# EasyEDA Pro project ProPrj_zuizhong2.epro, schematic zuizhong
Board Name: zuizhong; Create Date: 2025-02-10; Page Name: Sheet_1; Project Name: zuizhong; Schematic Name: zuizhong; Update Date: 2025-02-10; Add into BOM: yes; Company: Your Company; Convert to PCB: yes; Date: 2025-02-10; Draw By: ljy_yz; REV: 1.0; Sheet: 1/1
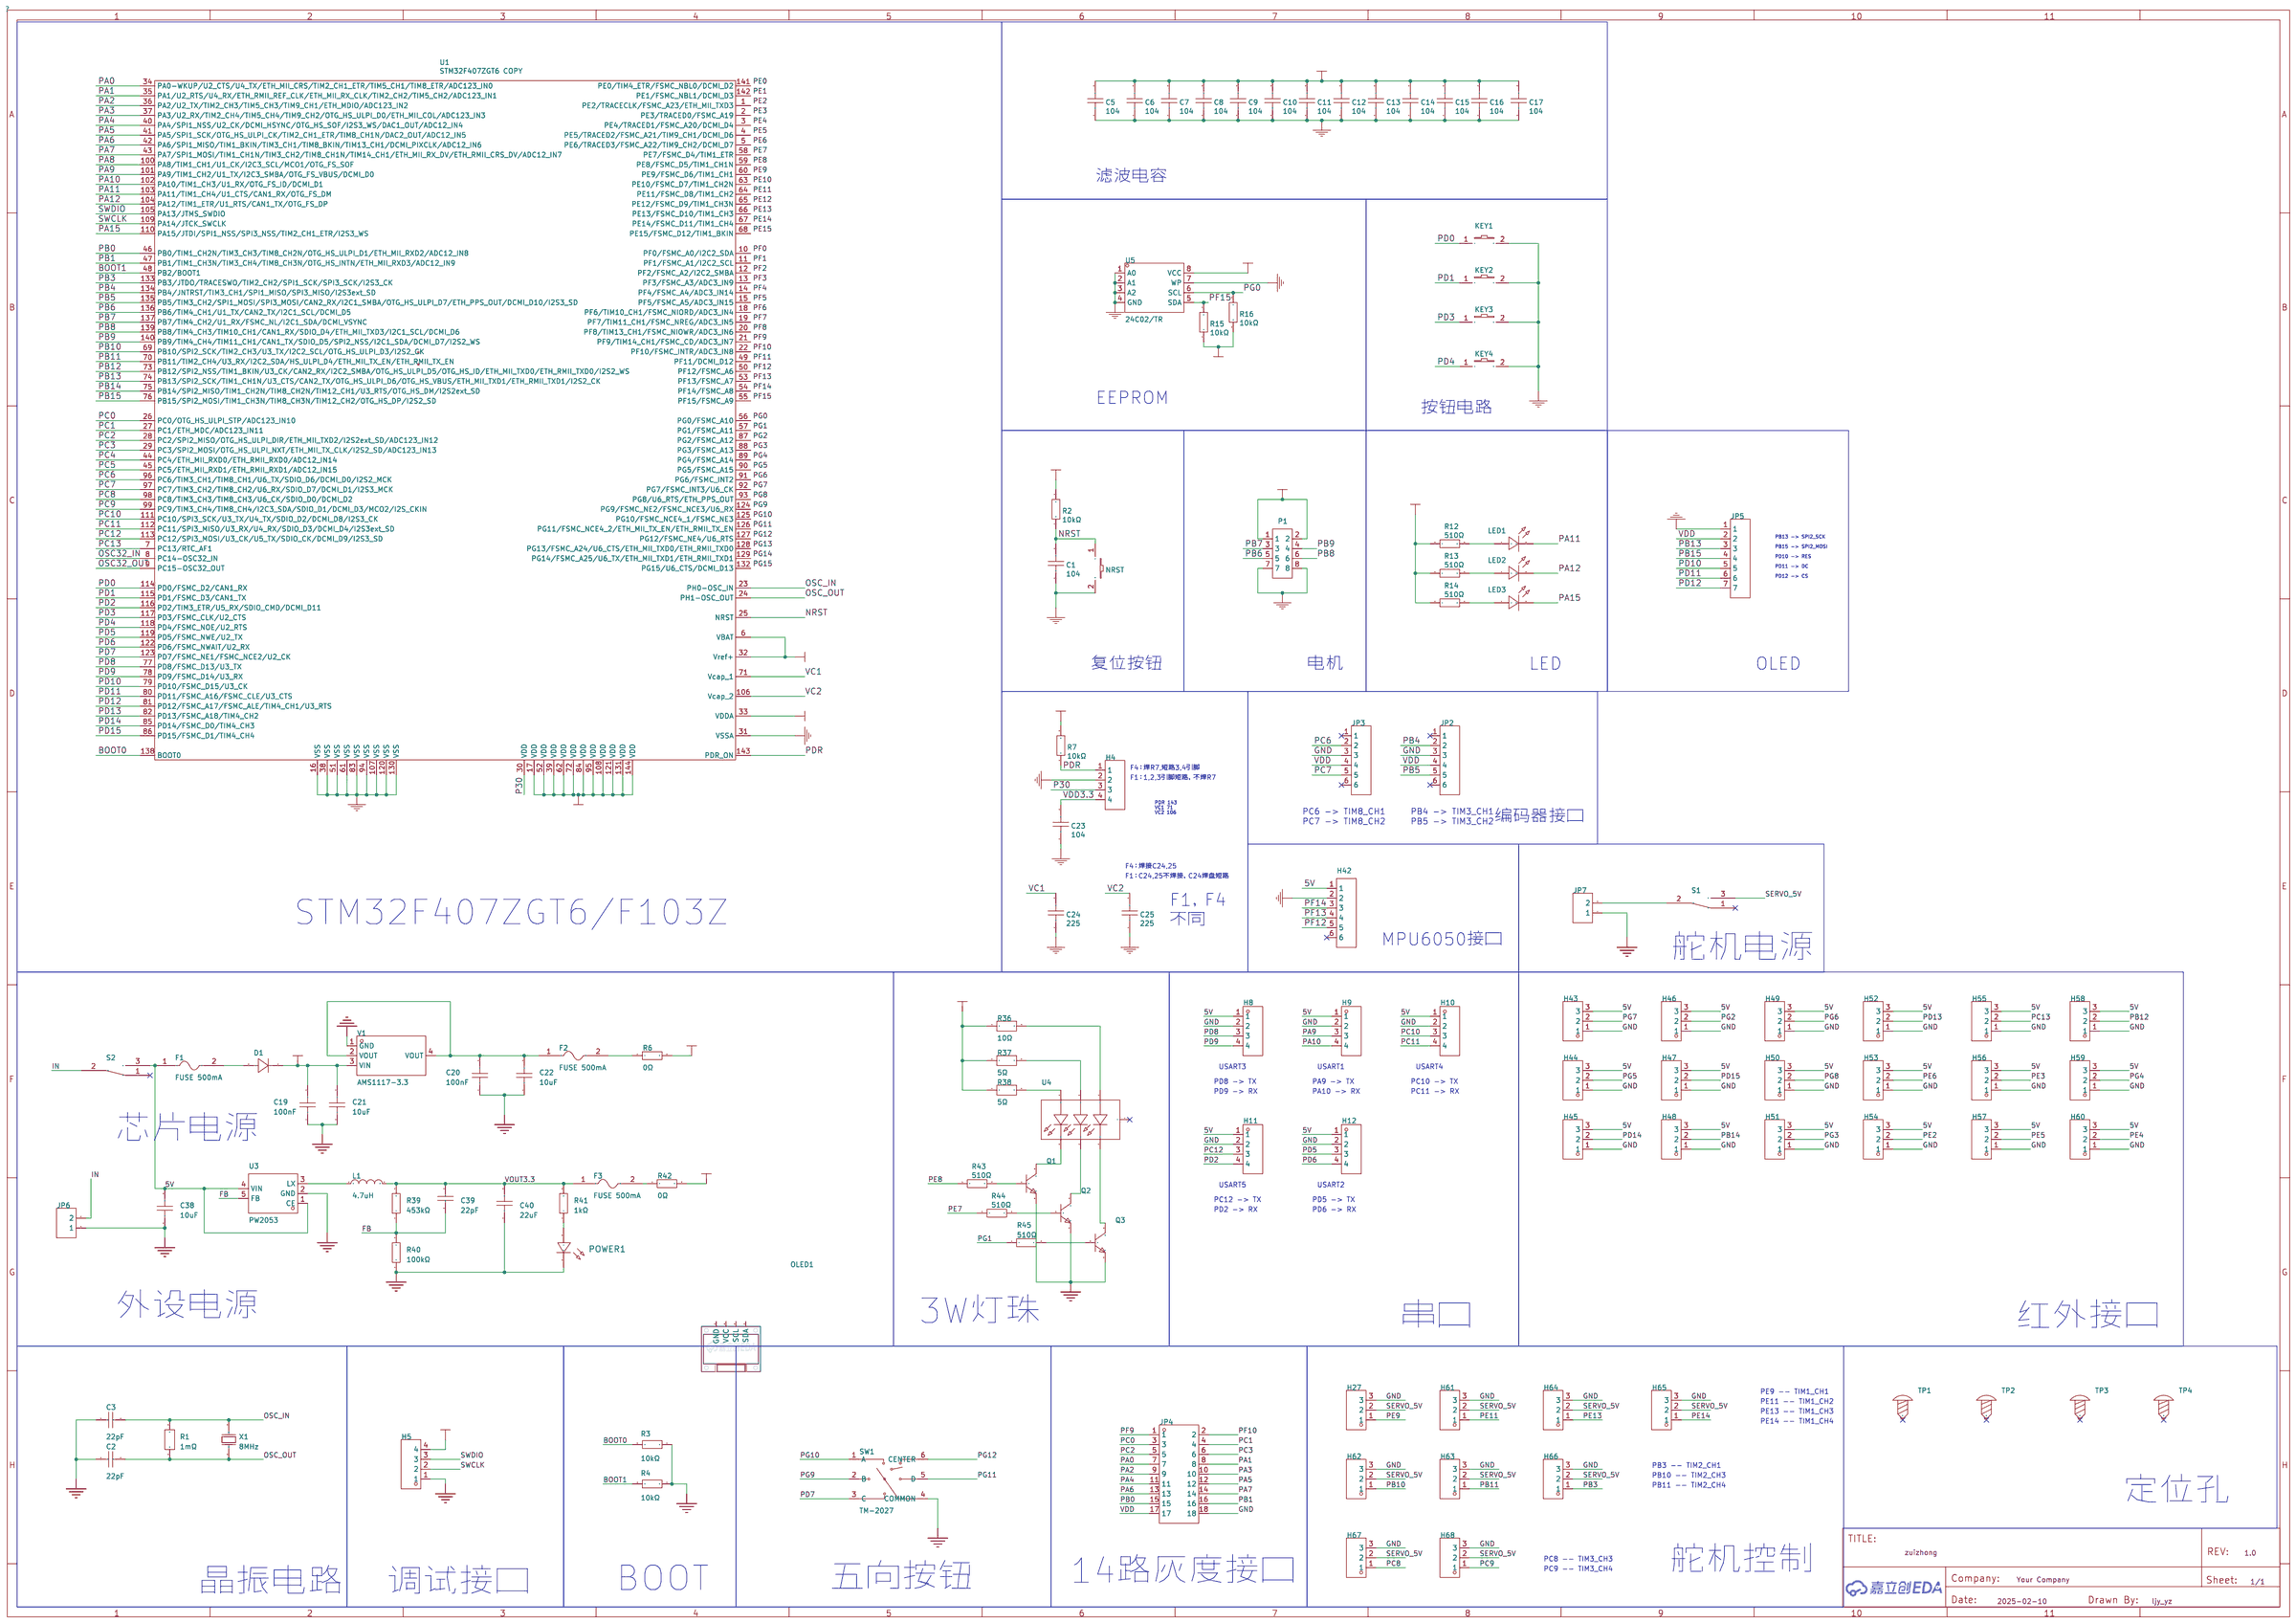
[diagram p0: schematic sheet]

## Parts
C1  104  [C0603]
C2  22pF  [C0603]
C3  22pF  [C0603]
C5  104  [C0603]
C6  104  [C0603]
C7  104  [C0603]
C8  104  [C0603]
C9  104  [C0603]
C10  104  [C0603]
C11  104  [C0603]
C12  104  [C0603]
C13  104  [C0603]
C14  104  [C0603]
C15  104  [C0603]
C16  104  [C0603]
C17  104  [C0603]
C19  100nF  [C0603]
C20  100nF  [C0603]
C21  10uF  [C0603]
C22  10uF  [C0603]
C23  104  [C0603]
C24  225  [C0603]
C25  225  [C0603]
C38  10uF  [C0603]
C39  22pF  [C0603]
C40  22uF  [C0805]
D1  -  [DO_1N4007]
F1  FUSE 500mA  [F1812]
F2  FUSE 500mA  [F1812]
F3  FUSE 500mA  [F1812]
H4  PZ254V-11-04P  [HDR-TH_4P-P2.54-V-M-1]
H5  PZ254V-11-04P  [HDR-TH_4P-P2.54-V-M]
H8  PZ254V-11-04P  [HDR-TH_4P-P2.54-V-M]
H9  PZ254V-11-04P  [HDR-TH_4P-P2.54-V-M]
H10  PZ254V-11-04P  [HDR-TH_4P-P2.54-V-M]
H11  PZ254V-11-04P  [HDR-TH_4P-P2.54-V-M]
H12  PZ254V-11-04P  [HDR-TH_4P-P2.54-V-M]
H27  PZ254V-11-03P  [HDR-TH_3P-P2.54-V-M]
H42  PZ254V-11-06P  [HDR-TH_6P-P2.54-V-M-1]
H43  PZ254V-11-03P  [HDR-TH_3P-P2.54-V-M]
H44  PZ254V-11-03P  [HDR-TH_3P-P2.54-V-M]
H45  PZ254V-11-03P  [HDR-TH_3P-P2.54-V-M]
H46  PZ254V-11-03P  [HDR-TH_3P-P2.54-V-M]
H47  PZ254V-11-03P  [HDR-TH_3P-P2.54-V-M]
H48  PZ254V-11-03P  [HDR-TH_3P-P2.54-V-M]
H49  PZ254V-11-03P  [HDR-TH_3P-P2.54-V-M]
H50  PZ254V-11-03P  [HDR-TH_3P-P2.54-V-M]
H51  PZ254V-11-03P  [HDR-TH_3P-P2.54-V-M]
H52  PZ254V-11-03P  [HDR-TH_3P-P2.54-V-M]
H53  PZ254V-11-03P  [HDR-TH_3P-P2.54-V-M]
H54  PZ254V-11-03P  [HDR-TH_3P-P2.54-V-M]
H55  PZ254V-11-03P  [HDR-TH_3P-P2.54-V-M]
H56  PZ254V-11-03P  [HDR-TH_3P-P2.54-V-M]
H57  PZ254V-11-03P  [HDR-TH_3P-P2.54-V-M]
H58  PZ254V-11-03P  [HDR-TH_3P-P2.54-V-M]
H59  PZ254V-11-03P  [HDR-TH_3P-P2.54-V-M]
H60  PZ254V-11-03P  [HDR-TH_3P-P2.54-V-M]
H61  PZ254V-11-03P  [HDR-TH_3P-P2.54-V-M]
H62  PZ254V-11-03P  [HDR-TH_3P-P2.54-V-M]
H63  PZ254V-11-03P  [HDR-TH_3P-P2.54-V-M]
H64  PZ254V-11-03P  [HDR-TH_3P-P2.54-V-M]
H65  PZ254V-11-03P  [HDR-TH_3P-P2.54-V-M]
H66  PZ254V-11-03P  [HDR-TH_3P-P2.54-V-M]
H67  PZ254V-11-03P  [HDR-TH_3P-P2.54-V-M]
H68  PZ254V-11-03P  [HDR-TH_3P-P2.54-V-M]
JP2  PZ254V-11-06P  [HDR-TH_6P-P2.54-V-M-1]
JP3  PZ254V-11-06P  [HDR-TH_6P-P2.54-V-M-1]
JP4  PZ254V-12-18P  [HDR-TH_18P-P2.54-V-M-R2-C9-S2.54]
JP5  PM254V-11-07-H85  [HDR-TH_7P-P2.54-V-M-1]
JP6  -  [HDR-TH_2P-P2.54-V-F]
JP7  -  [HDR-TH_2P-P2.54-V-F]
KEY1  K2-3.6×6.1_SMD  [Key_SMD_3x4x2]
KEY2  K2-3.6×6.1_SMD  [Key_SMD_3x4x2]
KEY3  K2-3.6×6.1_SMD  [Key_SMD_3x4x2]
KEY4  K2-3.6×6.1_SMD  [Key_SMD_3x4x2]
L1  4.7uH  [IND-SMD_L2.5-W2.0-VLS252012CX-150M]
LED1  LED-0603_R  [LED0603-RD_WHITE]
LED2  LED-0603_R  [LED0603-RD_WHITE]
LED3  LED-0603_R  [LED0603-RD_WHITE]
NRST  K2-3.6×6.1_SMD  [Key_SMD_3x4x2]
OLED1  -  [0.96OLED_4P]
P1  PM254-2-04-W-8.5  [HDR-TH_8P-P2.54-H-F-R2-C4-W8.5]
POWER1  -  [LED_0603]
Q1  -  [S8050_SOT-23]
Q2  -  [S8050_SOT-23]
Q3  -  [S8050_SOT-23]
R1  1mΩ  [RES-SMD_L6.4-W3.2-R2512]
R2  10kΩ  [R0603_NEW]
R3  10kΩ  [R0603_NEW]
R4  10kΩ  [R0603_NEW]
R6  0Ω  [R0603]
R7  10kΩ  [R0603_NEW]
R12  510Ω  [R0603_NEW]
R13  510Ω  [R0603_NEW]
R14  510Ω  [R0603_NEW]
R15  10kΩ  [R0603_NEW]
R16  10kΩ  [R0603_NEW]
R36  10Ω  [R2512]
R37  5Ω  [R2512]
R38  5Ω  [R2512]
R39  453kΩ  [R0402]
R40  100kΩ  [R0603]
R41  1kΩ  [R0603]
R42  0Ω  [R0603]
R43  510Ω  [R0603_NEW]
R44  510Ω  [R0603_NEW]
R45  510Ω  [R0603_NEW]
S1  MT-0-102-A101-M200-RS  [SW-TH_MT-0-103-A101-M200-RS]
S2  MT-0-102-A101-M200-RS  [SW-TH_MT-0-103-A101-M200-RS]
SW1  TM-2027  [SW-SMD_6P-P2.80-L10.2-W10.2]
TP1  -  [M3螺丝]
TP2  -  [M3螺丝]
TP3  -  [M3螺丝]
TP4  -  [M3螺丝]
U1  STM32F407ZGT6 COPY  [LQFP-144_L20.0-W20.0-P0.50-LS22.0-BL]
U3  PW2053  [SOT-23-5_L2.9-W1.6-P0.95-LS2.8-BL]
U4  XL-HD6070RGBC-A46L-BD  [LED-SMD_6P-BD8.0-LS14.5]
U5  24C02/TR  [SOIC-8_L5.0-W4.0-P1.27-LS6.0-BL]
V1  AMS1117-3.3  [SOT-223-3_L6.5-W3.4-P2.30-LS7.0-BR]
X1  8MHz  [OSC-SMD_L5.0-W3.2]

## Library data of the parts
C1 C5-C17 C23 = 104: Supplier: LCSC; Supplier Part: C6119867; Manufacturer: HRE(芯声); Manufacturer Part: CGA0603X7R104K500JT; JLCPCB Part Class: Extended Part
C2 C3 C39 = CC0603JRNPO9BN220: 容值:22pF;精度:±5%;额定电压:50V;材质(温度系数):NP0;; LCSC Part Name: 22pF ±5% 50V; Supplier Part: C105620; Manufacturer: YAGEO(国巨); Supplier Footprint: 0603; JLCPCB Part Class: 扩展库; Datasheet: https://atta.szlcsc.com/upload/public/pdf/source/20170505/1493957838062.pdf; Supplier: LCSC; Tolerance: ±5%; Voltage Rated: 50V; Temperature Coefficient: NP0
C19 C20 = CGA0603X7R104K500JT: 容值:100nF;精度:±10%;额定电压:50V;材质(温度系数):X7R;; LCSC Part Name: 100nF ±10% 50V; Supplier Part: C6119867; Manufacturer: HRE(芯声); Supplier Footprint: 0603; JLCPCB Part Class: 扩展库; Supplier: LCSC; Tolerance: ±10%; Voltage Rated: 50V; Temperature Coefficient: X7R
C21 C22 C38 = CGA0603X5R106K100JT: 容值:10uF;精度:±10%;额定电压:10V;材质(温度系数):X5R;; LCSC Part Name: 10uF ±10% 10V; Supplier Part: C6119842; Manufacturer: HRE(芯声); Supplier Footprint: 0603; JLCPCB Part Class: 扩展库; Supplier: LCSC; Tolerance: ±10%; Voltage Rated: 10V; Temperature Coefficient: X5R
C24 C25 = 225: Supplier: LCSC; Supplier Part: C913904; Manufacturer: SAMSUNG(三星); Manufacturer Part: CL10A225KB8NNNC; JLCPCB Part Class: Extended Part
C40 = CGA0805X5R226M350MT: 容值:22uF;精度:±20%;额定电压:35V;材质(温度系数):X5R;; LCSC Part Name: 22uF ±20% 35V; Supplier Part: C6119901; Manufacturer: HRE(芯声); Supplier Footprint: 0805; JLCPCB Part Class: 扩展库; Datasheet: https://atta.szlcsc.com/upload/public/pdf/source/20231129/D589D0CC4D260F7AC3A77E53B455CCB3.pdf; Supplier: LCSC; Tolerance: ±20%; Voltage Rated: 35V; Temperature Coefficient: X5R
D1 = D_1N4007A: Supplier Footprint: DO-41
F1-F3 = mSMD050-60V: 最大电压:60V;最大电流:100A;保持电流:500mA;跳闸电流:1A;; LCSC Part Name: 0.50A  60V 自恢复保险丝; Supplier Part: C70113; Manufacturer: 台湾陆海; Supplier Footprint: 1812; JLCPCB Part Class: 扩展库; Datasheet: https://atta.szlcsc.com/upload/public/pdf/source/20210511/C70113_9F360CEF46030BB0E1728371F919C576.pdf; Supplier: LCSC; Operating Voltage (Max): 60V; Current Rating (Max): 100A; Hold Current: 500mA; Trip Current: 1A
H4 = PZ254V-11-04P: Supplier: LCSC; Supplier Part: C2691448; Manufacturer: XFCN(兴飞); JLCPCB Part Class: Extended Part
H5 H8-H12 = PZ254V-11-04P: 插针结构:1x4P;间距:2.54mm;行距:-;圆针/方针:方针;安装类型:直插;排数:单排;总PIN位数:4P;额定电流:3A;额定电压:250V;配合针长度:6mm;塑高:2.5mm;端接针长度:3mm;触头材质:-;工作温度范围:-40℃~+105℃;颜色:黑色;; LCSC Part Name: 间距:2.54mm 1x4P 直插 方针; Supplier Part: C2691448; Manufacturer: XFCN(兴飞); Supplier Footprint: 插件,P=2.54mm; JLCPCB Part Class: 扩展库; Datasheet: https://atta.szlcsc.com/upload/public/pdf/source/20200309/C492403_F9F19131791D08044AD4F84F8E751A34.pdf; Supplier: LCSC; Pin Structure: 1x4P; Pitch: 2.54mm; Circluar Pins/Square Pins: 方针; Mounting Type: 直插; Number of Rows: 单排; Number of Pins: 4P; Current Rating (Max): 3A; Voltage Rating (Max): 250V; Length of Mating Pin: 6mm; Insulation Height: 2.5mm; Length of End Connection Pin: 3mm; Operating Temperature Range: -40℃~+105℃; Color: 黑色
H27 H43-H68 = PZ254V-11-03P: 插针结构:1x3P;间距:2.54mm;行距:-;圆针/方针:方针;安装类型:直插;排数:单排;总PIN位数:3P;额定电流:3A;额定电压:250V;配合针长度:6mm;塑高:2.5mm;端接针长度:3mm;工作温度范围:-40℃~+105℃;颜色:黑色;; LCSC Part Name: 间距:2.54mm 1x3P 直插 方针; Supplier Part: C2937625; Manufacturer: XFCN(兴飞); Supplier Footprint: 插件,P=2.54mm; JLCPCB Part Class: 扩展库; Datasheet: https://atta.szlcsc.com/upload/public/pdf/source/20200309/C492402_8335C3D49C4E4C618838D59BB1D024C1.pdf; Supplier: LCSC; Pin Structure: 1x3P; Pitch: 2.54mm; Circluar Pins/Square Pins: 方针; Mounting Type: 直插; Number of Rows: 单排; Number of Pins: 3P; Current Rating (Max): 3A; Voltage Rating (Max): 250V; Length of Mating Pin: 6mm; Insulation Height: 2.5mm; Length of End Connection Pin: 3mm; Operating Temperature Range: -40℃~+105℃; Color: 黑色
H42 JP2 JP3 = PZ254V-11-06P: Supplier: LCSC; Supplier Part: C492405; Manufacturer: XFCN(兴飞); JLCPCB Part Class: Extended Part
JP4 = PZ254V-12-18P: 插针结构:2x9P;间距:2.54mm;行距:2.54mm;圆针/方针:方针;安装类型:直插;排数:双排;总PIN位数:18P;额定电流:-;额定电压:-;配合针长度:6mm;塑高:2.5mm;端接针长度:3mm;触头材质:黄铜;触头镀层:-;工作温度范围:-40℃~+105℃;颜色:黑色;; LCSC Part Name: 间距:2.54mm 2x9P 直插 方针; Supplier Part: C492426; Manufacturer: XFCN(兴飞); Supplier Footprint: 插件,P=2.54mm; JLCPCB Part Class: 扩展库; Datasheet: https://atta.szlcsc.com/upload/public/pdf/source/20200309/C492426_5A028E8D656C282E0A73DD02D6DCA7C4.pdf; Supplier: LCSC; Pin Structure: 2x9P; Pitch: 2.54mm; Row Spacing: 2.54mm; Circluar Pins/Square Pins: 方针; Mounting Type: 直插; Number of Rows: 双排; Number of Pins: 18P; Length of Mating Pin: 6mm; Insulation Height: 2.5mm; Length of End Connection Pin: 3mm; Contact Material: 黄铜; Operating Temperature Range: -40℃~+105℃; Color: 黑色
JP5 = PM254V-11-07-H85: Supplier: LCSC; Supplier Part: C2832270; Manufacturer: XFCN(兴飞); JLCPCB Part Class: Extended Part
JP6 JP7 = HDR-F_2.54_1x2P: Supplier Part: C49661; Supplier Footprint: 插件
KEY1-KEY4 NRST = K2-3.6×6.1_SMD: Supplier Part: C118141; Supplier: LCSC; Manufacturer Part: K2-1107ST-A4SW-06; 制造商: 韩国韩荣
L1 = FTC252010S4R7MBCA: 电感值:4.7uH;精度:±20%;额定电流:2A;饱和电流(Isat):2.6A;类型:一体成型电感;; LCSC Part Name: 4.7uH ±20% 2.6A; Supplier Part: C5832360; Manufacturer: cjiang(长江微电); Supplier Footprint: SMD,2x2.5mm; JLCPCB Part Class: 扩展库; Datasheet: https://atta.szlcsc.com/upload/public/pdf/source/20230602/8FFEDA9C0247A92A0D4B67554BFE4091.pdf; Supplier: LCSC; Tolerance: ±20%; Rated Current: 2A; Saturation Current (Isat): 2.6A; DC Resistance (DCR): 160mΩ; Type: 一体成型电感
LED1-LED3 = LED-0603_R: Manufacturer: EVERLIGHT(台湾亿光); Manufacturer Part: 19-217/R6C-AL1M2VY/3T; Supplier Part: C72044; Supplier: LCSC
OLED1 = 0.96OLED模块_4P: Supplier Footprint: 插件
P1 = PM254-2-04-W-8.5: Supplier: LCSC; Supplier Part: C2897424; Manufacturer: HCTL(华灿天禄); JLCPCB Part Class: Extended Part
POWER1 = LED_0603-R: Supplier Footprint: 0603
Q1-Q3 = S8050_SOT_NPN: Supplier Footprint: SOT-23
R1 = HoJLR2512-3W-1mR-1%: 电阻类型:采样电阻;阻值:1mΩ;精度:±1%;功率:3W;安装方式:贴片;; LCSC Part Name: 1mΩ ±1% 3W; Supplier Part: C2903470; Manufacturer: Milliohm(毫欧); Supplier Footprint: 2512; JLCPCB Part Class: 扩展库; Datasheet: https://atta.szlcsc.com/upload/public/pdf/source/20211009/7525CABAB363C979E942C1DD41F1FEF0.pdf; Supplier: LCSC; Type: 采样电阻; Tolerance: ±1%; Power(Watts): 3W; Mounting Sytle: 贴片
R2-R4 R7 R15 R16 = 10kΩ: Supplier: LCSC; Manufacturer: UNI-ROYAL(厚声); Manufacturer Part: 0603WAF1002T5E; Supplier Part: C25804; JLCPCB Part Class: Basic Part
R6 R42 = 0603WAF0000T5E: 电阻类型:厚膜电阻;阻值:0Ω;精度:±1%;功率:100mW;最大工作电压:75V;; LCSC Part Name: 0Ω ±1% 100mW 厚膜电阻; Supplier Part: C21189; Manufacturer: UNI-ROYAL(厚声); Supplier Footprint: 0603; JLCPCB Part Class: 基础库; Datasheet: https://atta.szlcsc.com/upload/public/pdf/source/20200306/C422600_1E6D84923E4A46A82E41ADD87F860B5C.pdf; Supplier: LCSC; Type: 厚膜电阻; Tolerance: ±1%; Power(Watts): 100mW; Overload Voltage (Max): 75V; Operating Temperature Range: -55℃~+155℃
R12-R14 R43-R45 = 510Ω: Supplier: LCSC; Manufacturer: UNI-ROYAL(厚声); Manufacturer Part: 0603WAF5100T5E; Supplier Part: C23193; JLCPCB Part Class: Basic Part
R36 = FRP2512J100 TS: 电阻类型:厚膜电阻;阻值:10Ω;精度:±5%;功率:2W;最大工作电压:200V;温度系数:±200ppm/℃;; LCSC Part Name: 10Ω ±5% 2W 厚膜电阻; Supplier Part: C3013385; Manufacturer: FOJAN(富捷); Supplier Footprint: 2512; JLCPCB Part Class: 扩展库; Datasheet: https://atta.szlcsc.com/upload/public/pdf/source/20211221/925EC7D7225764EE0046F22065062C87.pdf; Supplier: LCSC; Type: 厚膜电阻; Tolerance: ±5%; Power(Watts): 2W; Overload Voltage (Max): 200V; Temperature Coefficient: ±200ppm/℃
R37 R38 = HoAR2512-1W-5R-0.1%-TCR25: 电阻类型:陶瓷电阻;阻值:5Ω;精度:±0.1%;功率:1W;温度系数:±25ppm/℃;; LCSC Part Name: 陶瓷电阻 5Ω ±0.1% 1W; Supplier Part: C5123609; Manufacturer: Milliohm(毫欧); Supplier Footprint: 2512; JLCPCB Part Class: 扩展库; Datasheet: https://atta.szlcsc.com/upload/public/pdf/source/20220805/BC8894D01B21B12D20FF0E940066DD50.pdf; Supplier: LCSC; Type: 陶瓷电阻; Tolerance: ±0.1%; Power(Watts): 1W; Temperature Coefficient: ±25ppm/℃
R39 = 0402WGF4533TCE: 电阻类型:厚膜电阻;阻值:453kΩ;精度:±1%;功率:62.5mW;最大工作电压:50V;温度系数:±100ppm/℃;; LCSC Part Name: 453kΩ ±1% 62.5mW 厚膜电阻; Supplier Part: C27009; Manufacturer: UNI-ROYAL(厚声); Supplier Footprint: 0402; JLCPCB Part Class: 扩展库; Datasheet: https://atta.szlcsc.com/upload/public/pdf/source/20200306/C422600_1E6D84923E4A46A82E41ADD87F860B5C.pdf; Supplier: LCSC; Type: 厚膜电阻; Tolerance: ±1%; Power(Watts): 62.5mW; Overload Voltage (Max): 50V; Temperature Coefficient: ±100ppm/℃; Operating Temperature Range: -55℃~+155℃
R40 = 0603WAF1003T5E: 电阻类型:厚膜电阻;阻值:100kΩ;精度:±1%;功率:100mW;最大工作电压:75V;温度系数:±100ppm/℃;; LCSC Part Name: 100kΩ ±1% 100mW 厚膜电阻; Supplier Part: C25803; Manufacturer: UNI-ROYAL(厚声); Supplier Footprint: 0603; JLCPCB Part Class: 基础库; Datasheet: https://atta.szlcsc.com/upload/public/pdf/source/20200306/C422600_1E6D84923E4A46A82E41ADD87F860B5C.pdf; Supplier: LCSC; Type: 厚膜电阻; Tolerance: ±1%; Power(Watts): 100mW; Overload Voltage (Max): 75V; Temperature Coefficient: ±100ppm/℃; Operating Temperature Range: -55℃~+155℃
R41 = 0603WAF1001T5E: 电阻类型:厚膜电阻;阻值:1kΩ;精度:±1%;功率:100mW;最大工作电压:75V;温度系数:±100ppm/℃;; LCSC Part Name: 1kΩ ±1% 100mW 厚膜电阻; Supplier Part: C21190; Manufacturer: UNI-ROYAL(厚声); Supplier Footprint: 0603; JLCPCB Part Class: 基础库; Datasheet: https://atta.szlcsc.com/upload/public/pdf/source/20200306/C422600_1E6D84923E4A46A82E41ADD87F860B5C.pdf; Supplier: LCSC; Type: 厚膜电阻; Tolerance: ±1%; Power(Watts): 100mW; Overload Voltage (Max): 75V; Temperature Coefficient: ±100ppm/℃; Operating Temperature Range: -55℃~+155℃
S1 S2 = MT-0-102-A101-M200-RS: 电路结构:单刀双掷;机械寿命:-;额定电流:5A;额定电压(AC):125V;安装方式:直插;; LCSC Part Name: 小型钮子三脚二档 五件套; Supplier Part: C1788492; Manufacturer: YUEN FUNG(源丰); Supplier Footprint: 插件; JLCPCB Part Class: 扩展库; Datasheet: https://atta.szlcsc.com/upload/public/pdf/source/20230720/8E5C36EFDF374AE4FF4AC09DB233CE0E.pdf; Supplier: LCSC; Circuit: 单刀双掷; Switch Length: 13mm; Switch Width: 8mm; Switch Height: 28.6mm; Contact Current: 5A; Voltage Rating (AC): 125V; Actuator Type: 圆柱钮柄; Pin Style: 焊片; Mounting Style: 直插; Operating Temperature: -25℃~+85℃
SW1 = TM-2027: LCSC Part Name: 10*10多功能五向开关; Supplier Part: C318948; Manufacturer: XKB Connection(中国星坤); Supplier Footprint: SMD-6P,10x10mm; JLCPCB Part Class: 扩展库; Datasheet: https://atta.szlcsc.com/upload/public/pdf/source/20211015/9A47D7046B5F70B5D407F93F21F2FBAF.pdf; Supplier: LCSC
TP1-TP4 = M3螺丝: Supplier Footprint: 插件
U1 = STM32F407ZGT6 COPY: Supplier: 鸿星尔克
U3 = PW2053: Supplier Part: C9900013179; Supplier Footprint: SOT-23-5; JLCPCB Part Class: 扩展库; Supplier: LCSC
U4 = XL-HD6070RGBC-A46L-BD: 6070球头七彩3W（6脚） 仿流明/大功率 回流焊≤220℃; LCSC Part Name: 球头七彩; Supplier Part: C22434861; Manufacturer: XINGLIGHT(成兴光); Supplier Footprint: SMD8080-6P; JLCPCB Part Class: 扩展库; Datasheet: https://atta.szlcsc.com/upload/public/pdf/source/20240516/D3778ABDB5CABE9CC0417A8C2EA1DFA9.pdf; Supplier: LCSC
U5 = 24C02/TR: 接口类型:I2C;存储容量:2Kbit;时钟频率(fc):1MHz;; LCSC Part Name: 24C02/TR 停产; Supplier Part: C316692; Manufacturer: HGSEMI(华冠); Supplier Footprint: SOIC-8; JLCPCB Part Class: 扩展库; Datasheet: https://atta.szlcsc.com/upload/public/pdf/source/20181022/C316692_1A8AF8718EBD0B12F50671BDFB0B8E66.pdf; Supplier: LCSC; Interface Type: I2C; Memory Size: 2Kbit; Clock Frequency (fc): 1MHz; Supply Voltage: 1.7V~5.5V; Write Cycle Time (Tw): 5ms; Data Retention - TDR (Year): 100年; Write Cycle Endurance: 1000000次; Operating Temperature: -40℃~+85℃
V1 = AMS1117-3.3_C6186: 输出类型:固定;最大输入电压:-;输出电压:3.3V;最大输出电流:1A;电源纹波抑制比(PSRR):72dB@(120Hz);输出极性:正极;; LCSC Part Name: 输出3.3V 1A; Supplier Part: C6186; Manufacturer: AMS; Supplier Footprint: SOT-223; JLCPCB Part Class: 基础库; Datasheet: https://atta.szlcsc.com/upload/public/pdf/source/20180727/C6186_7A095716F0823C02F1997A905E26C086.pdf; Supplier: LCSC; Output Type: 固定; Output Voltage: 3.3V; MAX Output Current: 1A; Power Supply Rejection Ratio (PSRR): 72dB@(120Hz); Dropout Voltage: 1.3V@(800mA); Output Polarity: 正极; Number of Outputs: 1
X1 = TAXM8M2QLFCDT1T: 晶振类型:贴片晶振;频率:8MHz;常温频差:±30ppm;外接负载电容:20pF;频率稳定度(全温):±20ppm;; LCSC Part Name: 8MHz ±30ppm 20pF; Supplier Part: C122522; Manufacturer: YJX(雅晶鑫); Supplier Footprint: SMD5032; JLCPCB Part Class: 扩展库; Datasheet: https://atta.szlcsc.com/upload/public/pdf/source/20220113/59EE8A0E7B9F67FF1BF3C454890DE4E5.pdf; Supplier: LCSC; Crystal Type: 贴片晶振; Normal temperature Frequency Tolerance: ±30ppm; External load capacitor: 20pF; Frequency Stability(Full temperature range): ±20ppm; Equivalent Series Resistance (ESR): 80Ω; Operating Temperature: -40℃~+85℃

## Nets
5V: C38.2 F1.1 H8.1 H9.1 H10.1 H11.1 H12.1 H42.1 H43.3 H44.3 H45.3 H46.3 H47.3 H48.3 H49.3 H50.3 H51.3 H52.3 H53.3 H54.3 H55.3 H56.3 H57.3 H58.3 H59.3 H60.3 R36.1 R37.1 R38.1 S2.3 U3.1(CE) U3.4(VIN)
GND: C1.1 C2.1 C3.1 C5.1 C6.1 C7.1 C8.1 C9.1 C10.1 C11.1 C12.1 C13.1 C14.1 C15.1 C16.1 C17.1 C19.1 C20.1 C21.1 C22.1 C23.1 C24.1 C25.1 C38.1 C40.1 H4.2 H5.1 H8.2 H9.2 H10.2 H11.2 H12.2 H27.3 H42.2 H43.1 H44.1 H45.1 H46.1 H47.1 H48.1 H49.1 H50.1 H51.1 H52.1 H53.1 H54.1 H55.1 H56.1 H57.1 H58.1 H59.1 H60.1 H61.3 H62.3 H63.3 H64.3 H65.3 H66.3 H67.3 H68.3 JP2.3 JP3.3 JP4.18 JP5.1 JP6.1 JP7.1 KEY1.2 KEY2.2 KEY3.2 KEY4.2 NRST.2 P1.7 P1.8 POWER1.1(C) Q1.2 Q2.2 Q3.2 R3.1 R4.1 R40.1 SW1.4(COMMON) U1.16(VSS) U1.31(VSSA) U1.38(VSS) U1.51(VSS) U1.61(VSS) U1.83(VSS) U1.94(VSS) U1.107(VSS) U1.120(VSS) U1.130(VSS) U3.2(GND) U5.1(A0) U5.2(A1) U5.3(A2) U5.4(GND) U5.7(WP) V1.1(GND)
VDD: JP2.4 JP3.4 JP4.17 JP5.2 P1.1 P1.2 R42.2
VDD3.3: C5.2 C6.2 C7.2 C8.2 C9.2 C10.2 C11.2 C12.2 C13.2 C14.2 C15.2 C16.2 C17.2 C23.2 H4.4 H5.4 R2.2 R6.2 R7.2 R12.1 R13.1 R14.1 R15.1 R16.1 U1.6(VBAT) U1.17(VDD) U1.32(Vref+) U1.33(VDDA) U1.39(VDD) U1.52(VDD) U1.62(VDD) U1.72(VDD) U1.84(VDD) U1.95(VDD) U1.108(VDD) U1.121(VDD) U1.131(VDD) U1.144(VDD) U5.8(VCC)
BOOT0: R3.2 U1.138(BOOT0)
BOOT1: R4.2 U1.48(PB2/BOOT1)
FB: C39.1 R39.1 R40.2 U3.5(FB)
IN: JP6.2 S2.2
NRST: C1.2 NRST.1 R2.1 U1.25(NRST)
OSC32_IN: U1.8(PC14-OSC32_IN)
OSC32_OUT: U1.9(PC15-OSC32_OUT)
OSC_IN: C3.2 R1.2 U1.23(PH0-OSC_IN) X1.2(OSC2)
OSC_OUT: C2.2 R1.1 U1.24(PH1-OSC_OUT) X1.1(OSC1)
P30: H4.3 U1.30(VDD)
PA0: JP4.7 U1.34(PA0-WKUP/U2_CTS/U4_TX/ETH_MII_CRS/TIM2_CH1_ETR/TIM5_CH1/TIM8_ETR/ADC123_IN0)
PA1: JP4.8 U1.35(PA1/U2_RTS/U4_RX/ETH_RMII_REF_CLK/ETH_MII_RX_CLK/TIM2_CH2/TIM5_CH2/ADC123_IN1)
PA2: JP4.9 U1.36(PA2/U2_TX/TIM2_CH3/TIM5_CH3/TIM9_CH1/ETH_MDIO/ADC123_IN2)
PA3: JP4.10 U1.37(PA3/U2_RX/TIM2_CH4/TIM5_CH4/TIM9_CH2/OTG_HS_ULPI_D0/ETH_MII_COL/ADC123_IN3)
PA4: JP4.11 U1.40(PA4/SPI1_NSS/U2_CK/DCMI_HSYNC/OTG_HS_SOF/I2S3_WS/DAC1_OUT/ADC12_IN4)
PA5: JP4.12 U1.41(PA5/SPI1_SCK/OTG_HS_ULPI_CK/TIM2_CH1_ETR/TIM8_CH1N/DAC2_OUT/ADC12_IN5)
PA6: JP4.13 U1.42(PA6/SPI1_MISO/TIM1_BKIN/TIM3_CH1/TIM8_BKIN/TIM13_CH1/DCMI_PIXCLK/ADC12_IN6)
PA7: JP4.14 U1.43(PA7/SPI1_MOSI/TIM1_CH1N/TIM3_CH2/TIM8_CH1N/TIM14_CH1/ETH_MII_RX_DV/ETH_RMII_CRS_DV/ADC12_IN7)
PA8: U1.100(PA8/TIM1_CH1/U1_CK/I2C3_SCL/MCO1/OTG_FS_SOF)
PA9: H9.3 U1.101(PA9/TIM1_CH2/U1_TX/I2C3_SMBA/OTG_FS_VBUS/DCMI_D0)
PA10: H9.4 U1.102(PA10/TIM1_CH3/U1_RX/OTG_FS_ID/DCMI_D1)
PA11: LED1.2 U1.103(PA11/TIM1_CH4/U1_CTS/CAN1_RX/OTG_FS_DM)
PA12: LED2.2 U1.104(PA12/TIM1_ETR/U1_RTS/CAN1_TX/OTG_FS_DP)
PA15: LED3.2 U1.110(PA15/JTDI/SPI1_NSS/SPI3_NSS/TIM2_CH1_ETR/I2S3_WS)
PB0: JP4.15 U1.46(PB0/TIM1_CH2N/TIM3_CH3/TIM8_CH2N/OTG_HS_ULPI_D1/ETH_MII_RXD2/ADC12_IN8)
PB1: JP4.16 U1.47(PB1/TIM1_CH3N/TIM3_CH4/TIM8_CH3N/OTG_HS_INTN/ETH_MII_RXD3/ADC12_IN9)
PB3: H66.1 U1.133(PB3/JTDO/TRACESWO/TIM2_CH2/SPI1_SCK/SPI3_SCK/I2S3_CK)
PB4: JP2.2 U1.134(PB4/JNTRST/TIM3_CH1/SPI1_MISO/SPI3_MISO/I2S3ext_SD)
PB5: JP2.5 U1.135(PB5/TIM3_CH2/SPI1_MOSI/SPI3_MOSI/CAN2_RX/I2C1_SMBA/OTG_HS_ULPI_D7/ETH_PPS_OUT/DCMI_D10/I2S3_SD)
PB6: P1.5 U1.136(PB6/TIM4_CH1/U1_TX/CAN2_TX/I2C1_SCL/DCMI_D5)
PB7: P1.3 U1.137(PB7/TIM4_CH2/U1_RX/FSMC_NL/I2C1_SDA/DCMI_VSYNC)
PB8: P1.6 U1.139(PB8/TIM4_CH3/TIM10_CH1/CAN1_RX/SDIO_D4/ETH_MII_TXD3/I2C1_SCL/DCMI_D6)
PB9: P1.4 U1.140(PB9/TIM4_CH4/TIM11_CH1/CAN1_TX/SDIO_D5/SPI2_NSS/I2C1_SDA/DCMI_D7/I2S2_WS)
PB10: H62.1 U1.69(PB10/SPI2_SCK/TIM2_CH3/U3_TX/I2C2_SCL/OTG_HS_ULPI_D3/I2S2_CK)
PB11: H63.1 U1.70(PB11/TIM2_CH4/U3_RX/I2C2_SDA/HS_ULPI_D4/ETH_MII_TX_EN/ETH_RMII_TX_EN)
PB12: H58.2 U1.73(PB12/SPI2_NSS/TIM1_BKIN/U3_CK/CAN2_RX/I2C2_SMBA/OTG_HS_ULPI_D5/OTG_HS_ID/ETH_MII_TXD0/ETH_RMII_TXD0/I2S2_WS)
PB13: JP5.3 U1.74(PB13/SPI2_SCK/TIM1_CH1N/U3_CTS/CAN2_TX/OTG_HS_ULPI_D6/OTG_HS_VBUS/ETH_MII_TXD1/ETH_RMII_TXD1/I2S2_CK)
PB14: H48.2 U1.75(PB14/SPI2_MISO/TIM1_CH2N/TIM8_CH2N/TIM12_CH1/U3_RTS/OTG_HS_DM/I2S2ext_SD)
PB15: JP5.4 U1.76(PB15/SPI2_MOSI/TIM1_CH3N/TIM8_CH3N/TIM12_CH2/OTG_HS_DP/I2S2_SD)
PC0: JP4.3 U1.26(PC0/OTG_HS_ULPI_STP/ADC123_IN10)
PC1: JP4.4 U1.27(PC1/ETH_MDC/ADC123_IN11)
PC2: JP4.5 U1.28(PC2/SPI2_MISO/OTG_HS_ULPI_DIR/ETH_MII_TXD2/I2S2ext_SD/ADC123_IN12)
PC3: JP4.6 U1.29(PC3/SPI2_MOSI/OTG_HS_ULPI_NXT/ETH_MII_TX_CLK/I2S2_SD/ADC123_IN13)
PC4: U1.44(PC4/ETH_MII_RXD0/ETH_RMII_RXD0/ADC12_IN14)
PC5: U1.45(PC5/ETH_MII_RXD1/ETH_RMII_RXD1/ADC12_IN15)
PC6: JP3.2 U1.96(PC6/TIM3_CH1/TIM8_CH1/U6_TX/SDIO_D6/DCMI_D0/I2S2_MCK)
PC7: JP3.5 U1.97(PC7/TIM3_CH2/TIM8_CH2/U6_RX/SDIO_D7/DCMI_D1/I2S3_MCK)
PC8: H67.1 U1.98(PC8/TIM3_CH3/TIM8_CH3/U6_CK/SDIO_D0/DCMI_D2)
PC9: H68.1 U1.99(PC9/TIM3_CH4/TIM8_CH4/I2C3_SDA/SDIO_D1/DCMI_D3/MCO2/I2S_CKIN)
PC10: H10.3 U1.111(PC10/SPI3_SCK/U3_TX/U4_TX/SDIO_D2/DCMI_D8/I2S3_CK)
PC11: H10.4 U1.112(PC11/SPI3_MISO/U3_RX/U4_RX/SDIO_D3/DCMI_D4/I2S3ext_SD)
PC12: H11.3 U1.113(PC12/SPI3_MOSI/U3_CK/U5_TX/SDIO_CK/DCMI_D9/I2S3_SD)
PC13: H55.2 U1.7(PC13/RTC_AF1)
PD0: KEY1.1 U1.114(PD0/FSMC_D2/CAN1_RX)
PD1: KEY2.1 U1.115(PD1/FSMC_D3/CAN1_TX)
PD2: H11.4 U1.116(PD2/TIM3_ETR/U5_RX/SDIO_CMD/DCMI_D11)
PD3: KEY3.1 U1.117(PD3/FSMC_CLK/U2_CTS)
PD4: KEY4.1 U1.118(PD4/FSMC_NOE/U2_RTS)
PD5: H12.3 U1.119(PD5/FSMC_NWE/U2_TX)
PD6: H12.4 U1.122(PD6/FSMC_NWAIT/U2_RX)
PD7: SW1.3(C) U1.123(PD7/FSMC_NE1/FSMC_NCE2/U2_CK)
PD8: H8.3 U1.77(PD8/FSMC_D13/U3_TX)
PD9: H8.4 U1.78(PD9/FSMC_D14/U3_RX)
PD10: JP5.5 U1.79(PD10/FSMC_D15/U3_CK)
PD11: JP5.6 U1.80(PD11/FSMC_A16/FSMC_CLE/U3_CTS)
PD12: JP5.7 U1.81(PD12/FSMC_A17/FSMC_ALE/TIM4_CH1/U3_RTS)
PD13: H52.2 U1.82(PD13/FSMC_A18/TIM4_CH2)
PD14: H45.2 U1.85(PD14/FSMC_D0/TIM4_CH3)
PD15: H47.2 U1.86(PD15/FSMC_D1/TIM4_CH4)
PDR: H4.1 R7.1 U1.143(PDR_ON)
PE0: U1.141(PE0/TIM4_ETR/FSMC_NBL0/DCMI_D2)
PE1: U1.142(PE1/FSMC_NBL1/DCMI_D3)
PE2: H54.2 U1.1(PE2/TRACECLK/FSMC_A23/ETH_MII_TXD3)
PE3: H56.2 U1.2(PE3/TRACED0/FSMC_A19)
PE4: H60.2 U1.3(PE4/TRACED1/FSMC_A20/DCMI_D4)
PE5: H57.2 U1.4(PE5/TRACED2/FSMC_A21/TIM9_CH1/DCMI_D6)
PE6: H53.2 U1.5(PE6/TRACED3/FSMC_A22/TIM9_CH2/DCMI_D7)
PE7: R44.1 U1.58(PE7/FSMC_D4/TIM1_ETR)
PE8: R43.1 U1.59(PE8/FSMC_D5/TIM1_CH1N)
PE9: H27.1 U1.60(PE9/FSMC_D6/TIM1_CH1)
PE10: U1.63(PE10/FSMC_D7/TIM1_CH2N)
PE11: H61.1 U1.64(PE11/FSMC_D8/TIM1_CH2)
PE12: U1.65(PE12/FSMC_D9/TIM1_CH3N)
PE13: H64.1 U1.66(PE13/FSMC_D10/TIM1_CH3)
PE14: H65.1 U1.67(PE14/FSMC_D11/TIM1_CH4)
PE15: U1.68(PE15/FSMC_D12/TIM1_BKIN)
PF0: U1.10(PF0/FSMC_A0/I2C2_SDA)
PF1: U1.11(PF1/FSMC_A1/I2C2_SCL)
PF2: U1.12(PF2/FSMC_A2/I2C2_SMBA)
PF3: U1.13(PF3/FSMC_A3/ADC3_IN9)
PF4: U1.14(PF4/FSMC_A4/ADC3_IN14)
PF5: U1.15(PF5/FSMC_A5/ADC3_IN15)
PF6: U1.18(PF6/TIM10_CH1/FSMC_NIORD/ADC3_IN4)
PF7: U1.19(PF7/TIM11_CH1/FSMC_NREG/ADC3_IN5)
PF8: U1.20(PF8/TIM13_CH1/FSMC_NIOWR/ADC3_IN6)
PF9: JP4.1 U1.21(PF9/TIM14_CH1/FSMC_CD/ADC3_IN7)
PF10: JP4.2 U1.22(PF10/FSMC_INTR/ADC3_IN8)
PF11: U1.49(PF11/DCMI_D12)
PF12: H42.5 U1.50(PF12/FSMC_A6)
PF13: H42.4 U1.53(PF13/FSMC_A7)
PF14: H42.3 U1.54(PF14/FSMC_A8)
PF15: R15.2 U1.55(PF15/FSMC_A9) U5.5(SDA)
PG0: R16.2 U1.56(PG0/FSMC_A10) U5.6(SCL)
PG1: R45.1 U1.57(PG1/FSMC_A11)
PG2: H46.2 U1.87(PG2/FSMC_A12)
PG3: H51.2 U1.88(PG3/FSMC_A13)
PG4: H59.2 U1.89(PG4/FSMC_A14)
PG5: H44.2 U1.90(PG5/FSMC_A15)
PG6: H49.2 U1.91(PG6/FSMC_INT2)
PG7: H43.2 U1.92(PG7/FSMC_INT3/U6_CK)
PG8: H50.2 U1.93(PG8/U6_RTS/ETH_PPS_OUT)
PG9: SW1.2(B) U1.124(PG9/FSMC_NE2/FSMC_NCE3/U6_RX)
PG10: SW1.1(A) U1.125(PG10/FSMC_NCE4_1/FSMC_NE3)
PG11: SW1.5(D) U1.126(PG11/FSMC_NCE4_2/ETH_MII_TX_EN/ETH_RMII_TX_EN)
PG12: SW1.6(CENTER) U1.127(PG12/FSMC_NE4/U6_RTS)
PG13: U1.128(PG13/FSMC_A24/U6_CTS/ETH_MII_TXD0/ETH_RMII_TXD0)
PG14: U1.129(PG14/FSMC_A25/U6_TX/ETH_MII_TXD1/ETH_RMII_TXD1)
PG15: U1.132(PG15/U6_CTS/DCMI_D13)
SERVO_5V: H27.2 H61.2 H62.2 H63.2 H64.2 H65.2 H66.2 H67.2 H68.2 S1.3
SWCLK: H5.2 U1.109(PA14/JTCK_SWCLK)
SWDIO: H5.3 U1.105(PA13/JTMS_SWDIO)
TOP_5V: C19.2 C21.2 D1.1(K) V1.3(VIN)
VC1: C24.2 U1.71(Vcap_1)
VC2: C25.2 U1.106(Vcap_2)
VOUT3.3: C39.2 C40.2 F3.1 L1.2 R39.2 R41.2
$1N109: LED2.1 R13.2
$1N110: LED1.1 R12.2
$1N111: LED3.1 R14.2
$1N1986: JP7.2 S1.2
$1N2157: D1.2(A) F1.2
$1N2561: C20.2 C22.2 F2.1 V1.2(VOUT) V1.4(VOUT)
$1N3080: F2.2 R6.1
$1N3489: L1.1 U3.3(LX)
$1N4086: POWER1.2(A) R41.1
$1N4169: F3.2 R42.1
$1N7369: R38.2 U4.1(A)
$1N7374: R37.2 U4.3(A)
$1N7380: R36.2 U4.5(A)
$1N7591: Q1.3 U4.2(K)
$1N7596: Q2.3 U4.4(K)
$1N7602: Q3.3 U4.6(K)
$1N7608: Q1.1 R43.2
$1N7612: Q2.1 R44.2
$1N7617: Q3.1 R45.2

Not connected (* = marked no-connect by the designer): H42 6*; JP2 1* 6*; JP3 1* 6*; OLED1 1(GND) 2(VCC) 3(SCL) 4(SDA); S1 1*; S2 1*; TP1 1*; TP2 1*; TP3 1*; TP4 1*; U4 7*

## Notes on the sheet
- 滤波电容
- EEPROM
- 按钮电路
- PB13 -> SPI2_SCK
- PB15 -> SPI2_MOSI
- PD10 -> RES
- PD11 -> DC
- PD12 -> CS
- 复位按钮
- 电机
- LED
- OLED
- F4：焊R7,短路3,4引脚
- F1：1,2,3引脚短路，不焊R7
- PDR 143
- VC1 71
- VC2 106
- PC6 -> TIM8_CH1
- PB4 -> TIM3_CH1
- PC7 -> TIM8_CH2
- PB5 -> TIM3_CH2
- 编码器接口
- F4：焊接C24,25
- F1：C24,25不焊接，C24焊盘短路
- STM32F407ZGT6/F103Z
- F1，F4
  不同
- MPU6050接口
- 舵机电源
- USART3
- USART1
- USART4
- PD8 -> TX
- PA9 -> TX
- PC10 -> TX
- PD9 -> RX
- PA10 -> RX
- PC11 -> RX
- 芯片电源
- USART5
- USART2
- PC12 -> TX
- PD5 -> TX
- PD2 -> RX
- PD6 -> RX
- 外设电源
- 3W灯珠
- 串口
- 红外接口
- PE9 -- TIM1_CH1
- PE11 -- TIM1_CH2
- PE13 -- TIM1_CH3
- PE14 -- TIM1_CH4
- PB3 -- TIM2_CH1
- PB10 -- TIM2_CH3
- PB11 -- TIM2_CH4
- 定位孔
- PC8 -- TIM3_CH3
- PC9 -- TIM3_CH4
- 舵机控制
- 14路灰度接口
- 晶振电路
- 调试接口
- BOOT
- 五向按钮
